# Altium schematic sheet Rectifier_Section.SchDoc
size A4; DocumentNumber: 2; SheetNumber: 2; SheetTotal: 6
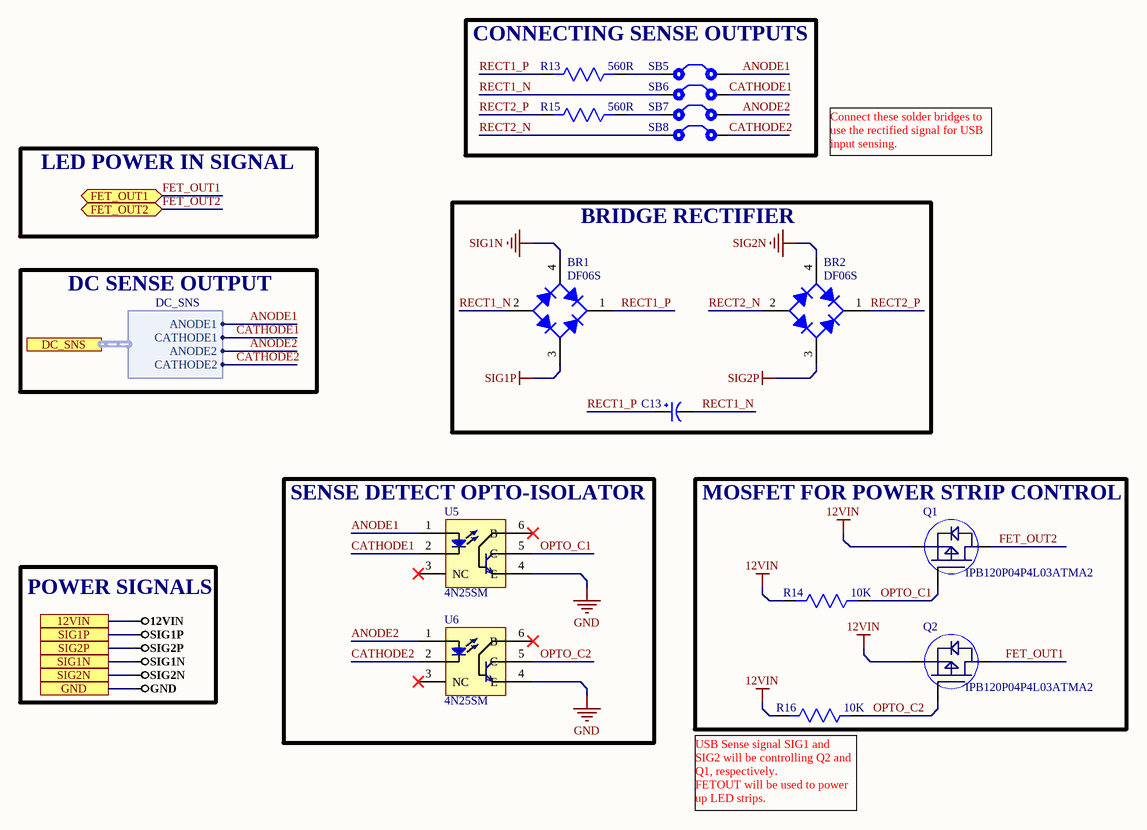
[diagram p0: Rectifier_Section.SchDoc]

## Parts
BR1  DF06S  [DF06S]
BR2  DF06S  [DF06S]
C13  33uF  [VE-330M1ETR-0605]  (value not drawn)
Q1  IPB120P04P4L03ATMA2  [IPB120P04P4L03ATMA2]
Q2  IPB120P04P4L03ATMA2  [IPB120P04P4L03ATMA2]
R13  560R  [RES 1210]
R14  10K  [RES 0805]
R15  560R  [RES 1210]
R16  10K  [RES 0805]
SB5  Solder Bridge  [Solder Bridge]  (value not drawn)
SB6  Solder Bridge  [Solder Bridge]  (value not drawn)
SB7  Solder Bridge  [Solder Bridge]  (value not drawn)
SB8  Solder Bridge  [Solder Bridge]  (value not drawn)
U5  4N25SM  [4N25/35M]
U6  4N25SM  [4N25/35M]

## Blocks framed on the sheet
CONNECTING SENSE OUTPUTS: R13 R15 SB5-SB8
BRIDGE RECTIFIER: BR1 BR2 C13
SENSE DETECT OPTO-ISOLATOR: U5 U6
MOSFET FOR POWER STRIP CONTROL: Q1 Q2 R14 R16

## Ports
12VIN, DC_SNS (harness DC_SNS), FET_OUT1 (bidir), FET_OUT2 (bidir), GND, SIG1N, SIG1P, SIG2N, SIG2P

## Harnesses
DC_SNS: ANODE1, CATHODE1, ANODE2, CATHODE2

## Nets
12VIN: Q1.3(S) Q2.3(S) R14.1 R16.1 ; port 12VIN
GND: U5.4(E) U6.4(E) ; port GND
SIG1N: BR1.4 ; port SIG1N
SIG1P: BR1.3 ; port SIG1P
SIG2N: BR2.4 ; port SIG2N
SIG2P: BR2.3 ; port SIG2P
ANODE1: SB5.2 U5.1(An) ; port DC_SNS.ANODE1
ANODE2: SB7.2 U6.1(An) ; port DC_SNS.ANODE2
CATHODE1: SB6.2 U5.2(Ca) ; port DC_SNS.CATHODE1
CATHODE2: SB8.2 U6.2(Ca) ; port DC_SNS.CATHODE2
FET_OUT1: Q2.2_4(D) ; port FET_OUT1
FET_OUT2: Q1.2_4(D) ; port FET_OUT2
OPTO_C1: Q1.1(G) R14.2 U5.5(C)
OPTO_C2: Q2.1(G) R16.2 U6.5(C)
RECT1_N: BR1.2(-) C13.2 SB6.1
RECT1_P: BR1.1(+) C13.1 R13.1
RECT2_N: BR2.2(-) SB8.1
RECT2_P: BR2.1(+) R15.1
NetR13_2: R13.2 SB5.1
NetR15_2: R15.2 SB7.1

Not connected (* = marked no-connect by the designer): U5 3(NC)* 6(B)*; U6 3(NC)* 6(B)*

## Notes on the sheet
- LED POWER IN SIGNAL
- Connect these solder bridges to use the rectified signal for USB input sensing.
- DC SENSE OUTPUT
- POWER SIGNALS
- (near R16) USB Sense signal SIG1 and SIG2 will be controlling Q2 and Q1, respectively.
  FETOUT will be used to power up LED strips.

## Library data of the parts
BR1 BR2 = DF06S: BRIDGE RECT 1PHASE 600V 1A DF-S; Manufacturer: ON Semiconductor / Fairchild; Forward Voltage: 1.1V; Peak Reverse Current: 5uA; Peak Non-Repetitive Surge Current: 50A; Element Configuration: Single; Number of Elements: 1; Forward Current: 1.5A; Capacitance: 1nF; Max Reverse Leakage Current: 50uA; Tolerance: 5%; Voltage Rating: 100V; Power Dissipation: 3.1W; Supplier 1: Digi-Key; Manufacturer Part Number: DF06S; Stock 1: 3050; Pricing 1: 1=0.5, 10=0.425, 25=0.3964, 100=0.2946, 500=0.23 (USD); Mount: Through Hole; Case/Package: SMD/SMT; Number of Pins: 4; Weight: 0.484g; Case Code (Metric): 1608; Case Code (Imperial): 0603; Min Operating Temperature: -55°C; Max Operating Temperature: 150°C; Packaging: Tape and Reel; Max Repetitive Reverse Voltage (Vrrm): 600V; Max Surge Current: 50A; Package Quantity: 10000; Current Rating: 1.5A; Voltage Rating (DC): 600V; Output Current: 1.5A; Max Forward Surge Current (Ifsm): 50A; Average Rectified Current: 1.5A; Termination: SMD/SMT; Max Power Dissipation: 3.1W; Length: 0.063inch; Height: 3.3mm; Width: 6.5mm; Thickness: 0.035inch; Radiation Hardening: No; Lead Free: Lead Free; REACH SVHC: No SVHC; ComponentLink1URL: http://www.farnell.com/datasheets/2161293.pdf?src-supplier=Element14; ComponentLink1Description: http://www.farnell.com/datasheets/2161293.pdf?src-supplier=Element14; ComponentLink2URL: https://www.fairchildsemi.com/datasheets/DF/DF08S.pdf?src-supplier=Avnet; ComponentLink2Description: https://www.fairchildsemi.com/datasheets/DF/DF08S.pdf?src-supplier=Avnet; ComponentLink3URL: http://www.fairchildsemi.com/ds/DF/DF08S.pdf?src-supplier=Avnet+Europe; ComponentLink3Description: http://www.fairchildsemi.com/ds/DF/DF08S.pdf?src-supplier=Avnet+Europe; ComponentLink4URL: http://www.fairchildsemi.com/ds/DF/DF06S.pdf?src-supplier=Future+Electronics; ComponentLink4Description: http://www.fairchildsemi.com/ds/DF/DF06S.pdf?src-supplier=Future+Electronics; ComponentLink5URL: https://www.fairchildsemi.com/datasheets/DF/DF005S.pdf?src-supplier=Digi-Key; ComponentLink5Description: https://www.fairchildsemi.com/datasheets/DF/DF005S.pdf?src-supplier=Digi-Key; ComponentLink6URL: http://www.mouser.com/ds/2/149/DF06S-190284.pdf?src-supplier=Mouser; ComponentLink6Description: http://www.mouser.com/ds/2/149/DF06S-190284.pdf?src-supplier=Mouser; ComponentLink7URL: http://datasheet.iiic.cc/fairchild/DF06S.pdf?src-supplier=IIIC; ComponentLink7Description: http://datasheet.iiic.cc/fairchild/DF06S.pdf?src-supplier=IIIC; Supplier Part Number 1: DF06SCT-ND
C13 = VE-330M1ETR-0605: Aluminum Electrolytic Capacitors - SMD 25 Volts 33uF 20% 6.3x5.3; Manufacturer: Lelon; Ripple Current: 67mA; Voltage Rating: 25V; Leakage Current: 3uA; Life (Hours): 2000Hour; Dissipation Factor: 0.14%; Supplier 1: Arrow Electronics; Manufacturer Part Number: VE-330M1ETR-0605; RoHS: Yes; Category: Aluminum Electrolytic Capacitors; Stock 1: 3000; Pricing 1: 1000=0.14450, 2000=0.13080, 4000=0.10990, 5000=0.10190, 10000=0.09820, 25000=0.09440 (USD); Case/Package: Aluminum; Min Operating Temperature: -40°C; Max Operating Temperature: 85°C; Tolerance: 20%; Capacitance: 33uF; Packaging: Tape and Reel; Package Quantity: 1000; Voltage Rating (DC): 25V; Termination: SMD/SMT; Series: VE; Construction: Cylindrical; Length: 5.3mm; Height: 6.6mm; Radiation Hardening: No; RoHS Compliant: Yes; ComponentLink1URL: https://www.verical.com/server-webapp/html/getDatasheet?partID=686789&src-supplier=Verical; ComponentLink1Description: https://www.verical.com/server-webapp/html/getDatasheet?partID=686789&src-supplier=Verical; ComponentLink2URL: http://components.arrow.com/part/dataview/0323_04207400?src-supplier=Arrow+Europe; ComponentLink2Description: http://components.arrow.com/part/dataview/0323_04207400?src-supplier=Arrow+Europe; ComponentLink3URL: http://www.lelon.com.tw/down.php?f=/file/7.pdf&n=VE.pdf&src-supplier=Mouser; ComponentLink3Description: http://www.lelon.com.tw/down.php?f=/file/7.pdf&n=VE.pdf&src-supplier=Mouser; Supplier Part Number 1: VE330M1ETR0605
Q1 Q2 = IPB120P04P4L03ATMA2: MOSFET P-CH 40V 120A TO263-3; Manufacturer: Infineon; Manufacturer Part Number: IPB120P04P4L-03; Rise Time: 16ns; Rds On Max: 3.1mR; Max Dual Supply Voltage: -40V; Gate to Source Voltage (Vgs): 16V; Fall Time: 57ns; Turn-Off Delay Time: 85ns; Max Power Dissipation: 136W; Turn-On Delay Time: 21ns; Input Capacitance: 11.38nF; Element Configuration: Single; Supplier 1: Digi-Key; RoHS: Yes; Category: MOSFETs; Pricing 1: 1=3.19000, 10=2.86100, 100=2.34420, 500=2.00360 (USD); Case/Package: TO-263-3; Number of Pins: 3; Min Operating Temperature: -55°C; Max Operating Temperature: 175°C; Packaging: Tape and Reel; Drain to Source Voltage (Vdss): -40V; Continuous Drain Current (ID): 120A; Drain to Source Resistance: 3.1mR; Power Dissipation: 136W; Drain to Source Breakdown Voltage: -40V; Length: 10mm; Width: 9.25mm; Height: 4.4mm; Halogen Free: Halogen Free; RoHS Compliant: Yes; REACH SVHC: No SVHC; ComponentLink1URL: http://www.infineon.com/dgdl/Infineon-IPP_B_I120P04P4L_03-DS-v01_00-en.pdf?fileId=db3a30432f69f146012f783b3b5a2e3f&ack=t&src-supplier=Avnet; ComponentLink1Description: http://www.infineon.com/dgdl/Infineon-IPP_B_I120P04P4L_03-DS-v01_00-en.pdf?fileId=db3a30432f69f146012f783b3b5a2e3f&ack=t&src-supplier=Avnet; ComponentLink2URL: http://www.infineon.com/dgdl/Infineon-IPP_B_I120P04P4L_03-DS-v01_00-en.pdf?fileId=db3a30432f69f146012f783b3b5a2e3f&ack=t&src-supplier=Avnet+Europe; ComponentLink2Description: http://www.infineon.com/dgdl/Infineon-IPP_B_I120P04P4L_03-DS-v01_00-en.pdf?fileId=db3a30432f69f146012f783b3b5a2e3f&ack=t&src-supplier=Avnet+Europe; ComponentLink3URL: http://www.farnell.com/datasheets/2018448.pdf?src-supplier=Element14; ComponentLink3Description: http://www.farnell.com/datasheets/2018448.pdf?src-supplier=Element14; Supplier Part Number 1: 448-IPB120P04P4L03ATMA2DKR-ND
R13 R15 = RC1210FR-07560RL: RES 560 OHM 1% 1/2W 1210; Manufacturer: Yageo; Power Rating: 500mW; Voltage Rating: 200V; Temperature Coefficient: 100ppm/°C; Supplier 1: Digi-Key; Manufacturer Part Number: RC1210FR-07560RL; RoHS: Yes; Category: Chip SMD Resistors; Pricing 1: 1=0.17000, 10=0.14900, 100=0.05740, 1000=0.02525, 2500=0.02181 (USD); Case/Package: 1210; Case Code (Imperial): 1210; Case Code (Metric): 3225; Size Code: 1210; Min Operating Temperature: -55°C; Max Operating Temperature: 155°C; Tolerance: 1%; Packaging: Tape and Reel; Resistance: 560R; Resistor Type: Thick Film; Termination: SMD/SMT; Number of Terminations: 2; Max Power Dissipation: 500mW; Features: Moisture Resistant; Series: RC; Construction: Rectangular; Length: 3.1mm; Width: 2.6mm; Height: 0.024inch; Depth: 2.6mm; Military Standard: Not; Lead Free: Lead Free; RoHS Compliant: Yes; ComponentLink1URL: https://datasheet.ciiva.com/12575/pyu-rc1210-51-rohs-l-4-12575621.pdf?src-supplier=Mouser; ComponentLink1Description: https://datasheet.ciiva.com/12575/pyu-rc1210-51-rohs-l-4-12575621.pdf?src-supplier=Mouser; Supplier Part Number 1: 13-RC1210FR-07560RLCT-ND
R14 R16 = 0805W8F1002T5E: ±1% 1/8W Thick Film Resistors 150V ±100ppm/℃ -55℃~+155℃ 10kΩ 0805 Chip Resistor - Surface Mount ROHS; Manufacturer: UNI-ROYAL; Manufacturer Part No: 0805W8F1002T5E; Package: 0805; Value: 10kΩ
SB5-SB8 = Solder Bridge: Solder Bridge ON
U5 U6 = 4N25SM: Opto Coupler General Purpose 6 Pin DIP Photo Transistor; Manufacturer: ON Semiconductor / Fairchild; Manufacturer Part Number: 4N25S-M; Forward Voltage: 1.5V; Number of Channels: 1; Collector Emitter Voltage (VCEO): 500mV; Max Output Voltage: 30V; Max Power Dissipation: 150mW; Reverse Breakdown Voltage: 6V; Forward Current: 60mA; Power Dissipation: 250mW; Max Collector Current: 50nA; Isolation Voltage: 7.5kV; Rise Time: 2us; Element Configuration: Single; Input Current: 10mA; Input Type: DC; Additional Feature: UL RECOGNIZED; Supplier 1: Avnet; RoHS: Yes; Category: Optocouplers; Stock 1: 3182; Pricing 1: 1000=0.21948, 1100=0.21355, 2100=0.20762, 5000=0.20169, 10000=0.19576, 50000=0.18982, 100000=0.18389 (USD); Mount: Surface Mount; Case/Package: SMD/SMT; Number of Pins: 6; Weight: 0.81g; Contact Plating: Tin,Matte; Terminal Finish: Tin; Min Operating Temperature: -40°C; Max Operating Temperature: 100°C; Packaging: Bulk; Package Quantity: 1000; Output Voltage: 30V; Collector Emitter Saturation Voltage: 500mV; Reverse Voltage (DC): 6V; Max Input Current: 60mA; Number of Elements: 1; Fall Time: 2us; Number of Circuits: 1; Series: -; Collector-emitter Voltage-Max: 500mV; Number of Functions: 1; Isolation Voltage-Max: 7.5kV; Radiation Hardening: No; RoHS Compliant: Yes; REACH SVHC: No SVHC; Lead Free: Lead Free; ComponentLink1URL: https://datasheet.ciiva.com/16746/4n25sm-16746231.pdf?src-supplier=Future+Electronics; ComponentLink1Description: https://datasheet.ciiva.com/16746/4n25sm-16746231.pdf?src-supplier=Future+Electronics; ComponentLink2URL: https://datasheet.ciiva.com/19453/1201795-19453506.pdf?src-supplier=Jameco; ComponentLink2Description: https://datasheet.ciiva.com/19453/1201795-19453506.pdf?src-supplier=Jameco; ComponentLink3URL: https://datasheet.ciiva.com/15118/getdatasheetpartid-60638-15118453.pdf?src-supplier=Verical; ComponentLink3Description: https://datasheet.ciiva.com/15118/getdatasheetpartid-60638-15118453.pdf?src-supplier=Verical; ComponentLink4URL: https://datasheet.ciiva.com/1246/683405-1246957.pdf?src-supplier=Element14; ComponentLink4Description: https://datasheet.ciiva.com/1246/683405-1246957.pdf?src-supplier=Element14; ComponentLink5URL: https://datasheet.ciiva.com/1246/683405-1246958.pdf?src-supplier=Element14; ComponentLink5Description: https://datasheet.ciiva.com/1246/683405-1246958.pdf?src-supplier=Element14; ComponentLink6URL: https://datasheet.ciiva.com/2087/4n25m-2087542.pdf?src-supplier=Digi-Key; ComponentLink6Description: https://datasheet.ciiva.com/2087/4n25m-2087542.pdf?src-supplier=Digi-Key; ComponentLink7URL: https://datasheet.ciiva.com/8084/4n25m-8084950.pdf?src-supplier=Avnet; ComponentLink7Description: https://datasheet.ciiva.com/8084/4n25m-8084950.pdf?src-supplier=Avnet; Supplier Part Number 1: 4N25SM